# Altium schematic sheet DC_DC_CONVERTER.SchDoc
size A4; SheetNumber: 17; SheetTotal: 20
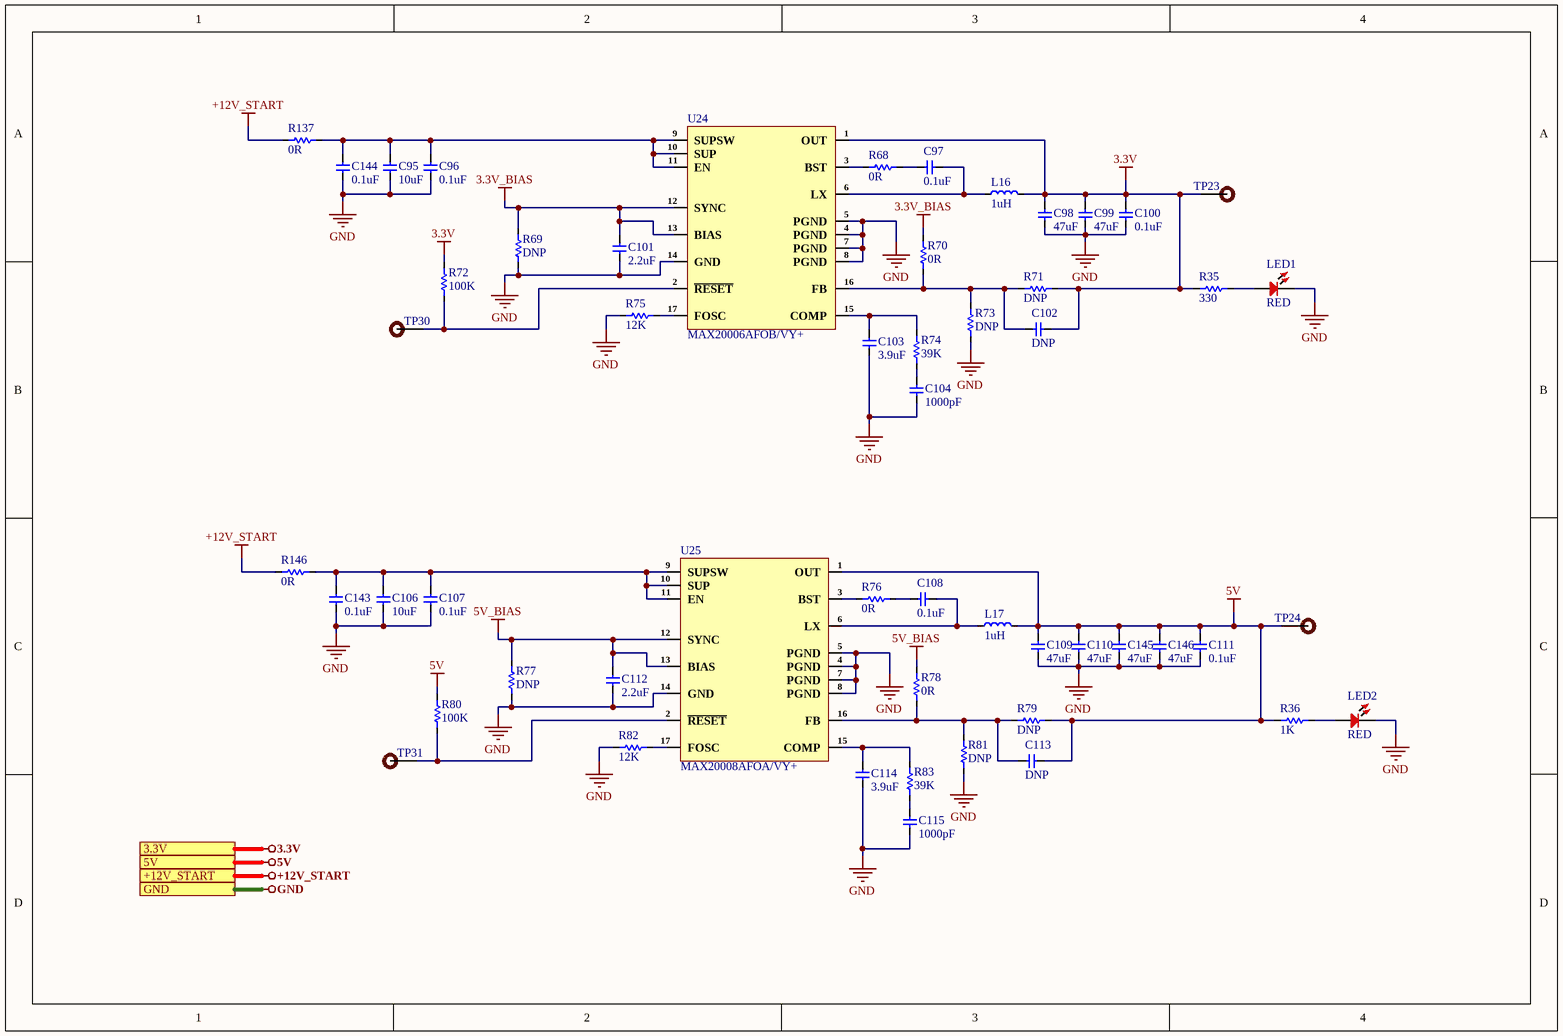
[diagram p0: DC_DC_CONVERTER.SchDoc]

## Parts
C95  10uF  [Cap-1206]
C96  0.1uF  [Cap-0603]
C97  0.1uF  [Cap-0603]
C98  47uF  [Cap 2220]
C99  47uF  [Cap 2220]
C100  0.1uF  [Cap-0402]
C101  2.2uF  [Cap-0603]
C102  DNP  [Cap-0402]
C103  3.9uF  [Cap-1206]
C104  1000pF  [Cap-0603]
C106  10uF  [Cap-1206]
C107  0.1uF  [Cap-0603]
C108  0.1uF  [Cap-0603]
C109  47uF  [Cap 2220]
C110  47uF  [Cap 2220]
C111  0.1uF  [Cap-0402]
C112  2.2uF  [Cap-0603]
C113  DNP  [Cap-0402]
C114  3.9uF  [Cap-1206]
C115  1000pF  [Cap-0603]
C143  0.1uF  [Cap-0603]
C144  0.1uF  [Cap-0603]
C145  47uF  [Cap 2220]
C146  47uF  [Cap 2220]
L16  1uH  [XAL6030-102MEC]
L17  1uH  [XAL6030-102MEC]
LED1  RED  [LED-0603]
LED2  RED  [LED-0603]
R35  330  [Res-0201]
R36  1K  [Res-0603]
R68  0R  [Res-0603]
R69  DNP  [Res-0603]
R70  0R  [Res-0603]
R71  DNP  [Res-0603]
R72  100K  [Res-0603]
R73  DNP  [Res-0603]
R74  39K  [Res-0603]
R75  12K  [Res-0603]
R76  0R  [Res-0603]
R77  DNP  [Res-0603]
R78  0R  [Res-0603]
R79  DNP  [Res-0603]
R80  100K  [Res-0603]
R81  DNP  [Res-0603]
R82  12K  [Res-0603]
R83  39K  [Res-0603]
R137  0R  [Res-1206]
R146  0R  [Res-1206]
TP23  DNP  [Test-point]  (value not drawn)
TP24  DNP  [Test-point]  (value not drawn)
TP30  DNP  [Test-point]  (value not drawn)
TP31  DNP  [Test-point]  (value not drawn)
U24  MAX20006AFOB/VY+  [17-FC2QFN (3.5x3.75)]
U25  MAX20008AFOA/VY+  [17-FC2QFN (3.5x3.75)]

## Ports
3.3V (see Top_Sheet[3D], 03-CAN2_SPI_CAN_CONTROLLER[1D], APALIS_POWER_SUPPLY[1D], CAN2_SPI_CAN_CONTROLLER[1D], GPIO_NC_INTERFACE[4B], I2C_INTERFACE[1B], LTE_MODULE[1D], Reset_and_SDIO[1D]), 5V (see Top_Sheet[4D], 03-CAN2_SPI_CAN_CONTROLLER[1D], CAN2_SPI_CAN_CONTROLLER[1D]), +12V_START (see Top_Sheet[4D], CONNECTORS[1D], DIGITAL_I-O_O-P[1D], INPUT_SUPPLY_PROTECTION[1C]), GND (see Top_Sheet[3D], 03-CAN2_SPI_CAN_CONTROLLER[1D], APALIS_POWER_SUPPLY[1D], CAN2_SPI_CAN_CONTROLLER[1D], CODEC_INTERFACE[1D], CONNECTORS[1D], DIGITAL_I-O_O-P[1D], ETHERNET_INTERFACE[1D], FUTURE_USE_CONNECTOR[1D], GPIO_NC_INTERFACE[4B], HDMI_INTERFACE[1D], I2C_INTERFACE[1B], INPUT_SUPPLY_PROTECTION[1D], LTE_MODULE[1D], MECHANICAL_FOR_PCB[1D], MICRO_SD_CARD_INTERFACE[1D], Reset_and_SDIO[1D], UART_INTERFACE[1D], USB3.0_INTERFACE[1D])

## Nets
3.3V: C98.2 C99.2 C100.2 C102.1 L16.2 R35.1 R71.2 R72.2 TP23.1 U24.1(OUT) ; port 3.3V
3.3V_BIAS: C101.2 R69.2 R70.2 U24.12(SYNC) U24.13(BIAS)
5V: C109.2 C110.2 C111.2 C113.1 C145.2 C146.2 L17.2 R36.1 R79.2 R80.2 TP24.1 U25.1(OUT) ; port 5V
5V_BIAS: C112.2 R77.2 R78.2 U25.12(SYNC) U25.13(BIAS)
+12V_START: R137.1 R146.1 ; port +12V_START
GND: C95.1 C96.1 C98.1 C99.1 C100.1 C101.1 C103.1 C104.1 C106.1 C107.1 C109.1 C110.1 C111.1 C112.1 C114.1 C115.1 C143.1 C144.1 C145.1 C146.1 LED1.2 LED2.2 R69.1 R73.1 R75.1 R77.1 R81.1 R82.1 U24.4(PGND) U24.5(PGND) U24.7(PGND) U24.8(PGND) U24.14(GND) U25.4(PGND) U25.5(PGND) U25.7(PGND) U25.8(PGND) U25.14(GND) ; port GND
NetC95_2: C95.2 C96.2 C144.2 R137.2 U24.9(SUPSW) U24.10(SUP) U24.11(EN)
NetC97_1: C97.1 R68.2
NetC97_2: C97.2 L16.1 U24.6(LX)
NetC102_2: C102.2 R70.1 R71.1 R73.2 U24.16(FB)
NetC103_2: C103.2 R74.2 U24.15(COMP)
NetC104_2: C104.2 R74.1
NetC106_2: C106.2 C107.2 C143.2 R146.2 U25.9(SUPSW) U25.10(SUP) U25.11(EN)
NetC108_1: C108.1 R76.2
NetC108_2: C108.2 L17.1 U25.6(LX)
NetC113_2: C113.2 R78.1 R79.1 R81.2 U25.16(FB)
NetC114_2: C114.2 R83.2 U25.15(COMP)
NetC115_2: C115.2 R83.1
NetLED1_1: LED1.1 R35.2
NetLED2_1: LED2.1 R36.2
NetR68_1: R68.1 U24.3(BST)
NetR72_1: R72.1 TP30.1 U24.2(~{RESET})
NetR75_2: R75.2 U24.17(FOSC)
NetR76_1: R76.1 U25.3(BST)
NetR80_1: R80.1 TP31.1 U25.2(~{RESET})
NetR82_2: R82.2 U25.17(FOSC)

## Library data of the parts
C95 C106 = C3216X7R1V106K160AC: CAP CER 10UF 35V X7R 1206; Manufacturer: TDK; Item Type: Capacitor; Supplier: Rs; Supplier Part Number: 9162964; Manufacturer Part Number: C3216X7R1V106K160AC; RoHS: Yes; Category: Ceramic Capacitors; Stock: 40; Pricing: 10=0.37, 100=0.324, 250=0.278, 500=0.231, 1000=0.185 (GBP); ComponentLink1URL: https://datasheet.ciiva.com/14905/tdkmlcccaprange-14905260.pdf?src-supplier=Digi-Key; ComponentLink1Description: https://datasheet.ciiva.com/14905/tdkmlcccaprange-14905260.pdf?src-supplier=Digi-Key; ComponentLink2URL: https://datasheet.ciiva.com/14905/tdkmlcccaprange-14905261.pdf?src-supplier=Digi-Key; ComponentLink2Description: https://datasheet.ciiva.com/14905/tdkmlcccaprange-14905261.pdf?src-supplier=Digi-Key; ComponentLink3URL: https://datasheet.ciiva.com/14905/tdkmlcccaprange-14905263.pdf?src-supplier=Digi-Key; ComponentLink3Description: https://datasheet.ciiva.com/14905/tdkmlcccaprange-14905263.pdf?src-supplier=Digi-Key
C96 C97 C107 C108 C143 C144 = CGA3E2X7R1H104K080AA: CAP CER 0.1UF 50V X7R 0603; Manufacturer: TDK; Material: 4241ConductorMaterial; Value: 100nF; Tolerance: 10%; Supplier: Rs; Supplier Part Number: 7882985P; Manufacturer Part Number: CGA3E2X7R1H104K080AA; RoHS: Yes; Category: Ceramic Capacitors; Stock: 235650; Pricing: 250=0.037, 500=0.034, 1000=0.033, 2500=0.029 (GBP); Mounting Technology: Surface Mount; Case/Package: 0603; Case Code (Imperial): 0603; Case Code (Metric): 1608; Weight: 7.1E-05oz; Min Operating Temperature: -55°C; Max Operating Temperature: 125°C; Packaging: Tape and Reel; Dielectric: X7R; Voltage Rating (DC): 50V; Package Quantity: 1; Voltage Rating: 50V; Termination: SMD/SMT; Voltage: 50V; Series: CGA; Length: 1.6mm; Width: 0.031inch; Height: 0.8mm; Depth: 0.8mm; Thickness: 0.035inch; Ratings: AEC-Q200; Radiation Hardening: No; Lead Free: Lead Free; RoHS Compliant: Yes; Reach SVHC Compliant: No; ComponentLink1URL: https://datasheet.ciiva.com/24216/cga3e2x7r1h104k080aa-266291-24216208.pdf?src-supplier=Mouser; ComponentLink1Description: https://datasheet.ciiva.com/24216/cga3e2x7r1h104k080aa-266291-24216208.pdf?src-supplier=Mouser; ComponentLink2URL: https://datasheet.ciiva.com/15192/getdatasheetpartid-715867-15192412.pdf?src-supplier=Verical; ComponentLink2Description: https://datasheet.ciiva.com/15192/getdatasheetpartid-715867-15192412.pdf?src-supplier=Verical; ComponentLink3URL: https://datasheet.ciiva.com/22725/1735392-22725642.pdf?src-supplier=Element14; ComponentLink3Description: https://datasheet.ciiva.com/22725/1735392-22725642.pdf?src-supplier=Element14; ComponentLink4URL: https://datasheet.ciiva.com/46385/1735392-46385708.pdf?src-supplier=Element14; ComponentLink4Description: https://datasheet.ciiva.com/46385/1735392-46385708.pdf?src-supplier=Element14; ComponentLink5URL: https://datasheet.ciiva.com/23803/1936565-23803084.pdf?src-supplier=Newark; ComponentLink5Description: https://datasheet.ciiva.com/23803/1936565-23803084.pdf?src-supplier=Newark; ComponentLink6URL: https://datasheet.ciiva.com/16500/mlccspec-automotive-general-midvoltage-en-16500693.pdf?src-supplier=Future+Electronics; ComponentLink6Description: https://datasheet.ciiva.com/16500/mlccspec-automotive-general-midvoltage-en-16500693.pdf?src-supplier=Future+Electronics
C98 C99 C109 C110 C145 C146 = CGA9N3X7R1E476M230KB: CAP CER 47UF 25V X7R 2220; Manufacturer: TDK; Material: 4241ConductorMaterial; Tolerance: 20%; Supplier: Rs; Supplier Part Number: 2427522; Manufacturer Part Number: CGA9N3X7R1E476M230KB; RoHS: Yes; Category: Ceramic Capacitors; Stock: 467; Pricing: 1=3.07, 5=2.92, 10=2.76, 20=2.46, 100=2 (GBP); Mounting Technology: Surface Mount; Case/Package: 2220; Case Code (Imperial): 2220; Case Code (Metric): 5750; Min Operating Temperature: -55°C; Max Operating Temperature: 125°C; Packaging: Cut Tape; Value: 47uF; Voltage Rating: 25V; Series: CGA; Length: 5.7mm; Width: 5mm; Height: 2.8mm; Ratings: AEC-Q200; RoHS Compliant: Yes; ComponentLink1URL: https://product.tdk.com/info/en/catalog/spec/mlccspec_automotive_general_midvoltage_en.pdf?src-supplier=Digi-Key; ComponentLink1Description: https://product.tdk.com/info/en/catalog/spec/mlccspec_automotive_general_midvoltage_en.pdf?src-supplier=Digi-Key; ComponentLink2URL: https://product.tdk.com/info/en/catalog/datasheets/mlcc_automotive_general_en.pdf?src-supplier=Digi-Key; ComponentLink2Description: https://product.tdk.com/info/en/catalog/datasheets/mlcc_automotive_general_en.pdf?src-supplier=Digi-Key; ComponentLink3URL: https://product.tdk.com/info/en/catalog/datasheets/mlcc_automotive_general_en.pdf?ref_disty=digikey&src-supplier=Digi-Key; ComponentLink3Description: https://product.tdk.com/info/en/catalog/datasheets/mlcc_automotive_general_en.pdf?ref_disty=digikey&src-supplier=Digi-Key; ComponentLink4URL: https://datasheet.octopart.com/CGA9N3X7R1E476M230KB-TDK-datasheet-43366117.pdf?src-supplier=Future+Electronics; ComponentLink4Description: https://datasheet.octopart.com/CGA9N3X7R1E476M230KB-TDK-datasheet-43366117.pdf?src-supplier=Future+Electronics
C100 C102 C111 C113 = C0402C104K4REC7867: Cap Cer 0402 0.1UF 16V X7R 10%; Manufacturer: KEMET; Item Type: Capacitor; Supplier: Digi-Key; Supplier Part Number: 399-C0402C104K4REC7867CT-ND; Manufacturer Part Number: C0402C104K4REC7867; RoHS: No; Category: Ceramic Capacitors; Stock: 10918; Pricing: 1=0.1, 10=0.072, 50=0.0408, 100=0.0338, 500=0.02372, 1000=0.01963, 2500=0.01827, 5000=0.01672 (USD)
C101 C112 = C1608X7R1A225K080AC: CAP CER 2.2UF 10V X7R 0603; Manufacturer: TDK; Dielectric Material: Ceramic; Tolerance: 10%; Item type: Capacitor; Supplier: Rs; Supplier Part Number: 9040237; Manufacturer Part Number: C1608X7R1A225K080AC; RoHS: Yes; Category: Ceramic Capacitors; Stock: 4700; Pricing: 50=0.061, 250=0.052, 500=0.043, 1000=0.04, 2000=0.036 (GBP); Mounting Technology: Surface Mount; Case/Package: 0603; Case Code (Metric): 1608; Case Code (Imperial): 0603; Weight: 7.1E-05oz; Min Operating Temperature: -55°C; Max Operating Temperature: 125°C; Packaging: Tape and Reel; Value: 2.2uF; Dielectric: X7R; Construction: Flat; Voltage Rating: 10V; Voltage Rating (DC): 10V; Series: C; Package Quantity: 4000; Termination: SMD/SMT; Length: 1.6mm; Width: 0.8mm; Height: 0.8mm; Depth: 0.8mm; Lead Free: Lead Free; Reach SVHC Compliant: No; RoHS Compliant: Yes; ComponentLink1URL: https://datasheet.ciiva.com/24216/c1608x7r1a225k080ac-264808-24216485.pdf?src-supplier=Mouser; ComponentLink1Description: https://datasheet.ciiva.com/24216/c1608x7r1a225k080ac-264808-24216485.pdf?src-supplier=Mouser; ComponentLink2URL: https://datasheet.ciiva.com/22718/1796654-22718012.pdf?src-supplier=Element14; ComponentLink2Description: https://datasheet.ciiva.com/22718/1796654-22718012.pdf?src-supplier=Element14; ComponentLink3URL: https://datasheet.ciiva.com/6290/tdkmlcccaprange-6290821.pdf?src-supplier=Digi-Key; ComponentLink3Description: https://datasheet.ciiva.com/6290/tdkmlcccaprange-6290821.pdf?src-supplier=Digi-Key; ComponentLink4URL: https://datasheet.ciiva.com/6290/tdkmlcccaprange-6290824.pdf?src-supplier=Digi-Key; ComponentLink4Description: https://datasheet.ciiva.com/6290/tdkmlcccaprange-6290824.pdf?src-supplier=Digi-Key; ComponentLink5URL: https://datasheet.ciiva.com/23802/1796654-23802775.pdf?src-supplier=Newark; ComponentLink5Description: https://datasheet.ciiva.com/23802/1796654-23802775.pdf?src-supplier=Newark; ComponentLink6URL: https://datasheet.ciiva.com/28451/1796654-28451240.pdf?src-supplier=Element14; ComponentLink6Description: https://datasheet.ciiva.com/28451/1796654-28451240.pdf?src-supplier=Element14; ComponentLink7URL: https://datasheet.ciiva.com/22725/1913358-22725529.pdf?src-supplier=Element14; ComponentLink7Description: https://datasheet.ciiva.com/22725/1913358-22725529.pdf?src-supplier=Element14
C103 C114 = C1206C395K3PAC7800: CAP CER 3.9UF 25V X5R 1206; Manufacturer: KEMET; Supplier: Digi-Key; Supplier Part Number: 399-C1206C395K3PAC7800CT-ND; Manufacturer Part Number: C1206C395K3PAC7800; RoHS: Yes; Category: Ceramic Capacitors; Stock: 4449; Pricing: 1=0.72, 10=0.532, 50=0.4252, 100=0.3645, 500=0.28856, 1000=0.243 (USD)
C104 C115 = C1608C0G2A102J080AA: CAP CER 1000PF 100V C0G 0603; Manufacturer: TDK; Item Type: Capacitor; Supplier: Rs; Supplier Part Number: 9040183; Manufacturer Part Number: C1608C0G2A102J080AA; RoHS: Yes; Category: Ceramic Capacitors; Stock: 300; Pricing: 100=0.033, 500=0.031, 1000=0.029, 2500=0.028, 5000=0.025 (GBP); ComponentLink1URL: https://datasheet.ciiva.com/24217/c1608c0g2a102j080aa-264625-24217039.pdf?src-supplier=Mouser; ComponentLink1Description: https://datasheet.ciiva.com/24217/c1608c0g2a102j080aa-264625-24217039.pdf?src-supplier=Mouser; ComponentLink2URL: https://datasheet.ciiva.com/16498/mid-volt-b11-16498805.pdf?src-supplier=Future+Electronics; ComponentLink2Description: https://datasheet.ciiva.com/16498/mid-volt-b11-16498805.pdf?src-supplier=Future+Electronics
L16 L17 = XAL6030-102MEC: Power Inductors - SMD 1uH Shld 20% 18A 6.18mOhms AECQ2; Manufacturer: Coilcraft; Core Material: Composite; Shielding: Shielded; Self Resonant Frequency: 50MHz; Test Frequency: 100kHz; Saturation Current: 23A; Supplier: Mouser; Supplier Part Number: 994-XAL6030-102MEC; Manufacturer Part Number: XAL6030-102MEC; RoHS: Yes; Category: Fixed Inductors; Stock: 25410; Pricing: 1=3.1, 10=3.1, 50=3.1, 100=3.1, 1000=1.82, 10000=1.66 (USD); Mounting Technology: Surface Mount; Case/Package: SMD/SMT; Min Operating Temperature: -40°C; Max Operating Temperature: 125°C; Packaging: Tape and Reel; Package Quantity: 400; Tolerance: 20%; Value: 1uH; Max DC Current: 18A; Termination: SMD/SMT; Series: XAL6030; Inductance Tolerance: 20%; RMS Current (Irms): 18A; Length: 6.76mm; Width: 6.56mm; Height: 3.1mm; Lead Free: Contains Lead; RoHS Compliant: Yes; Reach SVHC Compliant: No; ComponentLink1URL: https://datasheet.ciiva.com/22680/1681993-22680376.pdf?src-supplier=Element14; ComponentLink1Description: https://datasheet.ciiva.com/22680/1681993-22680376.pdf?src-supplier=Element14; ComponentLink2URL: https://datasheet.ciiva.com/22680/1681993-22680375.pdf?src-supplier=Element14; ComponentLink2Description: https://datasheet.ciiva.com/22680/1681993-22680375.pdf?src-supplier=Element14; ComponentLink3URL: https://datasheet.ciiva.com/13277/xal60xx-270658-13277255.pdf?src-supplier=Mouser; ComponentLink3Description: https://datasheet.ciiva.com/13277/xal60xx-270658-13277255.pdf?src-supplier=Mouser
LED1 LED2 = NCD0603R3: RED LED 0603 Light Emitting Diodes; Manufacturer: Foshan NationStar Optoelectronics; Manufacturer Part Number: NCD0603R3; Package: 0603; Item Type: LED; LCSC Part Number: C3151730; ComponentLink1Description: LCSC; ComponentLink1URL: https://www.lcsc.com/product-detail/Light-Emitting-Diodes-LED_Foshan-NationStar-Optoelectronics-NCD0603R3_C3151730.html
R35 = RC0201DR-07330RL: RES 330 OHM 0.5% 1/20W 0201; Manufacturer: Yageo; Value: 330R; Max Power Dissipation: 50mW; Temperature Coefficient: 200ppm/°C; Item Type: Resistor; Supplier 1: Digi-Key; Manufacturer Part Number: RC0201DR-07330RL; RoHS: Yes; Category: Chip SMD Resistors; Pricing 1: 10000=0.02267 (USD); Case/Package: 0201; Min Operating Temperature: -55°C; Max Operating Temperature: 125°C; Packaging: Tape and Reel; Number of Terminations: 2; Tolerance: 0.5%; Features: Moisture Resistant; Series: RC; Length: 0.024inch; Width: 0.012inch; Height: 0.01inch; RoHS Compliant: Yes; ComponentLink1URL: http://www.yageo.com.tw/exep/pages/download/literatures/PYu-R_INT-thick_7.pdf?src-supplier=Digi-Key; ComponentLink1Description: http://www.yageo.com.tw/exep/pages/download/literatures/PYu-R_INT-thick_7.pdf?src-supplier=Digi-Key; Supplier Part Number 1: RC0201DR-07330RL-ND; LCSC Part Number: C851717
R36 = RT0603BRD071KL: RES SMD 1K OHM 0.1% 1/10W 0603; Manufacturer: Yageo; Resistance: 1kR; Power Rating: 100mW; Voltage Rating: 75V; Temperature Coefficient: 25ppm/°C; Voltage Rating (DC): 50V; Item Type: Resistor; Supplier 1: Arrow Electronics; Manufacturer Part Number: RT0603BRD071KL; RoHS: Yes; Category: Chip SMD Resistors; Stock 1: 130000; Pricing 1: 5000=0.03900, 10000=0.03450, 25000=0.03070, 50000=0.02040 (USD); Mount: Surface Mount; Case/Package: 0603; Case Code (Metric): 1608; Case Code (Imperial): 0603; Contact Plating: Tin,Lead; Size Code: 0603; Min Operating Temperature: -55°C; Max Operating Temperature: 125°C; Package Quantity: 5000; Packaging: Tape and Reel; Resistor Type: Thin Film; Number of Terminations: 2; Termination: SMD/SMT; Max Power Dissipation: 100mW; Features: Moisture Resistant; Series: RT; Technology: THIN FILM; Construction: Rectangular; Length: 1.6mm; Width: 0.031inch; Height: 0.022inch; Depth: 0.8mm; Military Standard: Not; Lead Free: Lead Free; RoHS Compliant: Yes; ComponentLink1URL: https://datasheet.ciiva.com/11819/0900766b8079c86e-11819652.pdf?src-supplier=RSComponents; ComponentLink1Description: https://datasheet.ciiva.com/11819/0900766b8079c86e-11819652.pdf?src-supplier=RSComponents; ComponentLink2URL: https://datasheet.ciiva.com/5624/pyu-rt-1-to-0-05-rohs-l-4-5624759.pdf?src-supplier=Mouser; ComponentLink2Description: https://datasheet.ciiva.com/5624/pyu-rt-1-to-0-05-rohs-l-4-5624759.pdf?src-supplier=Mouser; ComponentLink3URL: https://datasheet.ciiva.com/29718/pyu-rt-1-to-0-05-rohs-l-4-29718010.pdf?src-supplier=Digi-Key; ComponentLink3Description: https://datasheet.ciiva.com/29718/pyu-rt-1-to-0-05-rohs-l-4-29718010.pdf?src-supplier=Digi-Key; ComponentLink4URL: https://datasheet.ciiva.com/29718/pyu-rt-1-to-0-05-rohs-l-4-29718011.pdf?src-supplier=Digi-Key; ComponentLink4Description: https://datasheet.ciiva.com/29718/pyu-rt-1-to-0-05-rohs-l-4-29718011.pdf?src-supplier=Digi-Key; Supplier Part Number 1: RT0603BRD071KL; LCSC Part Number: C110776
R68 R70 R76 R78 = ERJ-3GEY0R00V: RES SMD 0 OHM JUMPER 1/10W 0603; Manufacturer: Panasonic; Power Rating: 100mW; Voltage Rating: 75V; Tolerance: 0%; Temperature Coefficient: 200ppm/°C; Voltage Rating (DC): 50V; Supplier: Mouser; Supplier Part Number: 667-ERJ-3GEY0R00V; Manufacturer Part Number: ERJ-3GEY0R00V; RoHS: Yes; Category: Chip SMD Resistors; Stock: 9094861; Pricing: 1=0.1, 10=0.044, 50=0.044, 100=0.019, 1000=0.008, 5000=0.006, 10000=0.004 (USD); Mounting Technology: Surface Mount; Case/Package: 0603; Contact Plating: Tin; Case Code (Metric): 1608; Case Code (Imperial): 0603; Min Operating Temperature: -55°C; Max Operating Temperature: 155°C; Value: 0R; Resistor Type: Thick Film; Packaging: Tape and Reel; Package Quantity: 5000; Number of Terminations: 2; Termination: SMD/SMT; Max Power Dissipation: 100mW; Features: Automotive AEC-Q200; Series: ERJ; Construction: Rectangular; Technology: THICK FILM; Length: 1.6mm; Width: 0.8mm; Height: 0.45mm; Depth: 0.8mm; Ratings: AEC-Q200; Radiation Hardening: No; Reach SVHC Compliant: No; Military Standard: Not; Lead Free: Lead Free; RoHS Compliant: Yes; ComponentLink1URL: https://datasheet.ciiva.com/27055/1935748-27055113.pdf?src-supplier=Jameco; ComponentLink1Description: https://datasheet.ciiva.com/27055/1935748-27055113.pdf?src-supplier=Jameco; ComponentLink2URL: https://datasheet.ciiva.com/11808/0900766b80f806dd-11808207.pdf?src-supplier=Rs; ComponentLink2Description: https://datasheet.ciiva.com/11808/0900766b80f806dd-11808207.pdf?src-supplier=Rs; ComponentLink3URL: https://datasheet.ciiva.com/46377/1678796-46377868.pdf?src-supplier=Element14; ComponentLink3Description: https://datasheet.ciiva.com/46377/1678796-46377868.pdf?src-supplier=Element14; ComponentLink4URL: https://datasheet.ciiva.com/28695/1678796-28695833.pdf?src-supplier=Element14; ComponentLink4Description: https://datasheet.ciiva.com/28695/1678796-28695833.pdf?src-supplier=Element14; ComponentLink5URL: https://datasheet.ciiva.com/16834/aoa0000ce1-16834828.pdf?src-supplier=Future+Electronics; ComponentLink5Description: https://datasheet.ciiva.com/16834/aoa0000ce1-16834828.pdf?src-supplier=Future+Electronics; ComponentLink6URL: https://datasheet.ciiva.com/48532/aoa0000ce1-48532165.pdf?src-supplier=Avnet; ComponentLink6Description: https://datasheet.ciiva.com/48532/aoa0000ce1-48532165.pdf?src-supplier=Avnet; ComponentLink7URL: https://datasheet.ciiva.com/5959/1678796-5959707.pdf?src-supplier=Farnell; ComponentLink7Description: https://datasheet.ciiva.com/5959/1678796-5959707.pdf?src-supplier=Farnell; ComponentLink8URL: https://datasheet.ciiva.com/16758/70255313-16758527.pdf?src-supplier=Allied+Electronics; ComponentLink8Description: https://datasheet.ciiva.com/16758/70255313-16758527.pdf?src-supplier=Allied+Electronics; ComponentLink9URL: https://datasheet.ciiva.com/9198/aoa0000ce1-9198975.pdf?src-supplier=Avnet; ComponentLink9Description: https://datasheet.ciiva.com/9198/aoa0000ce1-9198975.pdf?src-supplier=Avnet; ComponentLink10URL: https://datasheet.ciiva.com/30199/4aoa0000ce1-30199822.pdf?src-supplier=Onlinecomponents.com; ComponentLink10Description: https://datasheet.ciiva.com/30199/4aoa0000ce1-30199822.pdf?src-supplier=Onlinecomponents.com; ComponentLink11URL: https://datasheet.ciiva.com/43460/1678796-43460647.pdf?src-supplier=Farnell; ComponentLink11Description: https://datasheet.ciiva.com/43460/1678796-43460647.pdf?src-supplier=Farnell
R69 R71 R72 R77 R79 R80 = RC0603FR-07100KL: RES 100K OHM 1% 1/10W 0603; Manufacturer: Yageo; Value: 100kR; Temperature Coefficient: 100ppm/°C; Voltage Rating (DC): 50V; Power Rating: 100mW; Supplier: Future Electronics; Supplier Part Number: 3697448; Manufacturer Part Number: RC0603FR-07100KL; RoHS: Yes; Category: Chip SMD Resistors; Stock: 11175000; Pricing: 5000=0.0013, 50000=0.0012, 75000=0.0014, 200000=0.0011, 250000=0.0014, 625000=0.0011, 750000=0.0013, 2000000=0.001, 2500000=0.0012 (USD); Case/Package: 0603; Pins: 2; Case Code (Imperial): 0603; Case Code (Metric): 1608; Min Operating Temperature: -55°C; Max Operating Temperature: 155°C; Tolerance: 1%; Resistor Type: Thick Film; Packaging: Tape and Reel; Voltage Rating: 50V; Termination: SMD/SMT; Number of Terminations: 2; Features: Moisture Resistant; Series: RC; Max Power Dissipation: 100mW; Resistance Tolerance: 1%; Construction: Rectangular; Technology: THICK FILM; Length: 1.6mm; Width: 0.8mm; Height: 0.45mm; Depth: 0.8mm; Reach SVHC Compliant: No; Lead Free: Lead Free; Military Standard: Not; RoHS Compliant: Yes
R73 R81 = ERJ-3GEY0R00V: RES SMD 0 OHM JUMPER 1/10W 0603; Manufacturer: Panasonic; Value: 0R; Power Rating: 100mW; Voltage Rating: 75V; Tolerance: 0%; Temperature Coefficient: 200ppm/°C; Voltage Rating (DC): 50V; Supplier: Mouser; Supplier Part Number: 667-ERJ-3GEY0R00V; Manufacturer Part Number: ERJ-3GEY0R00V; RoHS: Yes; Category: Chip SMD Resistors; Stock: 9094861; Pricing: 1=0.1, 10=0.044, 50=0.044, 100=0.019, 1000=0.008, 5000=0.006, 10000=0.004 (USD); Mounting Technology: Surface Mount; Case/Package: 0603; Contact Plating: Tin; Case Code (Metric): 1608; Case Code (Imperial): 0603; Min Operating Temperature: -55°C; Max Operating Temperature: 155°C; Resistor Type: Thick Film; Packaging: Tape and Reel; Package Quantity: 5000; Number of Terminations: 2; Termination: SMD/SMT; Max Power Dissipation: 100mW; Features: Automotive AEC-Q200; Series: ERJ; Construction: Rectangular; Technology: THICK FILM; Length: 1.6mm; Width: 0.8mm; Height: 0.45mm; Depth: 0.8mm; Ratings: AEC-Q200; Radiation Hardening: No; Reach SVHC Compliant: No; Military Standard: Not; Lead Free: Lead Free; RoHS Compliant: Yes; ComponentLink1URL: https://datasheet.ciiva.com/27055/1935748-27055113.pdf?src-supplier=Jameco; ComponentLink1Description: https://datasheet.ciiva.com/27055/1935748-27055113.pdf?src-supplier=Jameco; ComponentLink2URL: https://datasheet.ciiva.com/11808/0900766b80f806dd-11808207.pdf?src-supplier=Rs; ComponentLink2Description: https://datasheet.ciiva.com/11808/0900766b80f806dd-11808207.pdf?src-supplier=Rs; ComponentLink3URL: https://datasheet.ciiva.com/46377/1678796-46377868.pdf?src-supplier=Element14; ComponentLink3Description: https://datasheet.ciiva.com/46377/1678796-46377868.pdf?src-supplier=Element14; ComponentLink4URL: https://datasheet.ciiva.com/28695/1678796-28695833.pdf?src-supplier=Element14; ComponentLink4Description: https://datasheet.ciiva.com/28695/1678796-28695833.pdf?src-supplier=Element14; ComponentLink5URL: https://datasheet.ciiva.com/16834/aoa0000ce1-16834828.pdf?src-supplier=Future+Electronics; ComponentLink5Description: https://datasheet.ciiva.com/16834/aoa0000ce1-16834828.pdf?src-supplier=Future+Electronics; ComponentLink6URL: https://datasheet.ciiva.com/48532/aoa0000ce1-48532165.pdf?src-supplier=Avnet; ComponentLink6Description: https://datasheet.ciiva.com/48532/aoa0000ce1-48532165.pdf?src-supplier=Avnet; ComponentLink7URL: https://datasheet.ciiva.com/5959/1678796-5959707.pdf?src-supplier=Farnell; ComponentLink7Description: https://datasheet.ciiva.com/5959/1678796-5959707.pdf?src-supplier=Farnell; ComponentLink8URL: https://datasheet.ciiva.com/16758/70255313-16758527.pdf?src-supplier=Allied+Electronics; ComponentLink8Description: https://datasheet.ciiva.com/16758/70255313-16758527.pdf?src-supplier=Allied+Electronics; ComponentLink9URL: https://datasheet.ciiva.com/9198/aoa0000ce1-9198975.pdf?src-supplier=Avnet; ComponentLink9Description: https://datasheet.ciiva.com/9198/aoa0000ce1-9198975.pdf?src-supplier=Avnet; ComponentLink10URL: https://datasheet.ciiva.com/30199/4aoa0000ce1-30199822.pdf?src-supplier=Onlinecomponents.com; ComponentLink10Description: https://datasheet.ciiva.com/30199/4aoa0000ce1-30199822.pdf?src-supplier=Onlinecomponents.com; ComponentLink11URL: https://datasheet.ciiva.com/43460/1678796-43460647.pdf?src-supplier=Farnell; ComponentLink11Description: https://datasheet.ciiva.com/43460/1678796-43460647.pdf?src-supplier=Farnell
R74 R83 = ERJ-3EKF3902V: RES SMD 39K OHM 1% 1/10W 0603; Manufacturer: Panasonic; Supplier: Mouser; Supplier Part Number: 667-ERJ-3EKF3902V; Manufacturer Part Number: ERJ-3EKF3902V; RoHS: Yes; Category: Chip SMD Resistors; Stock: 186285; Pricing: 1=0.1, 10=0.024, 50=0.024, 100=0.011, 1000=0.008, 10000=0.005 (USD); ComponentLink1URL: https://datasheet.ciiva.com/5860/aoa0000ce2-5860662.pdf?src-supplier=Farnell; ComponentLink1Description: https://datasheet.ciiva.com/5860/aoa0000ce2-5860662.pdf?src-supplier=Farnell; ComponentLink2URL: https://datasheet.ciiva.com/9190/aoa0000ce2-9190015.pdf?src-supplier=Avnet; ComponentLink2Description: https://datasheet.ciiva.com/9190/aoa0000ce2-9190015.pdf?src-supplier=Avnet; ComponentLink3URL: https://datasheet.ciiva.com/24165/aoa0000ce2-24165687.pdf?src-supplier=Mouser; ComponentLink3Description: https://datasheet.ciiva.com/24165/aoa0000ce2-24165687.pdf?src-supplier=Mouser; ComponentLink4URL: https://datasheet.ciiva.com/30120/aoa0000ce2-30120364.pdf?src-supplier=Onlinecomponents.com; ComponentLink4Description: https://datasheet.ciiva.com/30120/aoa0000ce2-30120364.pdf?src-supplier=Onlinecomponents.com; ComponentLink5URL: https://datasheet.ciiva.com/46445/1678782-46445791.pdf?src-supplier=Element14; ComponentLink5Description: https://datasheet.ciiva.com/46445/1678782-46445791.pdf?src-supplier=Element14; ComponentLink6URL: https://datasheet.ciiva.com/7944/aoa0000ce2-7944620.pdf?src-supplier=Element14; ComponentLink6Description: https://datasheet.ciiva.com/7944/aoa0000ce2-7944620.pdf?src-supplier=Element14; ComponentLink7URL: https://datasheet.ciiva.com/22684/1678782-22684789.pdf?src-supplier=Element14; ComponentLink7Description: https://datasheet.ciiva.com/22684/1678782-22684789.pdf?src-supplier=Element14; ComponentLink8URL: https://datasheet.ciiva.com/22687/1678782-22687416.pdf?src-supplier=Element14; ComponentLink8Description: https://datasheet.ciiva.com/22687/1678782-22687416.pdf?src-supplier=Element14
R75 R82 = ERJ3EKF1202V: RES SMD 12K OHM 1% 1/10W 0603; Manufacturer: Panasonic; Value: 12kR; Temperature Coefficient: 100ppm/°C; Power Rating: 100mW; Voltage Rating: 75V; Supplier: Mouser; Supplier Part Number: 667-ERJ-3EKF1202V; Manufacturer Part Number: ERJ3EKF1202V; RoHS: Yes; Category: Chip SMD Resistors; Stock: 240811; Pricing: 1=0.1, 10=0.024, 50=0.024, 100=0.011, 1000=0.008, 10000=0.006 (USD); Mounting Technology: Surface Mount; Case/Package: 0603; Pins: 2; Contact Plating: Tin; Case Code (Metric): 1608; Case Code (Imperial): 0603; Weight: 7.1E-05oz; Min Operating Temperature: -55°C; Max Operating Temperature: 155°C; Tolerance: 1%; Packaging: Tape and Reel; Resistor Type: Thick Film; Number of Terminations: 2; Termination: SMD/SMT; Max Power Dissipation: 100mW; Voltage Rating (DC): 75V; Features: Automotive AEC-Q200; Package Quantity: 5000; Series: ERJ; Resistance Tolerance: 1%; Construction: Rectangular; Length: 1.6mm; Width: 0.8mm; Height: 0.45mm; Depth: 0.8mm; Radiation Hardening: No; Reach SVHC Compliant: No; Military Standard: Not; Lead Free: Lead Free; RoHS Compliant: Yes; ComponentLink1URL: https://datasheet.ciiva.com/6138/aoa0000ce2-6138712.pdf?src-supplier=Farnell; ComponentLink1Description: https://datasheet.ciiva.com/6138/aoa0000ce2-6138712.pdf?src-supplier=Farnell; ComponentLink2URL: https://datasheet.ciiva.com/7944/aoa0000ce2-7944617.pdf?src-supplier=Element14; ComponentLink2Description: https://datasheet.ciiva.com/7944/aoa0000ce2-7944617.pdf?src-supplier=Element14; ComponentLink3URL: https://datasheet.ciiva.com/22673/1678782-22673693.pdf?src-supplier=Element14; ComponentLink3Description: https://datasheet.ciiva.com/22673/1678782-22673693.pdf?src-supplier=Element14; ComponentLink4URL: https://datasheet.ciiva.com/22687/1678782-22687413.pdf?src-supplier=Element14; ComponentLink4Description: https://datasheet.ciiva.com/22687/1678782-22687413.pdf?src-supplier=Element14; ComponentLink5URL: https://datasheet.ciiva.com/46420/1678782-46420333.pdf?src-supplier=Element14; ComponentLink5Description: https://datasheet.ciiva.com/46420/1678782-46420333.pdf?src-supplier=Element14; ComponentLink6URL: https://datasheet.ciiva.com/24165/aoa0000ce2-24165037.pdf?src-supplier=Mouser; ComponentLink6Description: https://datasheet.ciiva.com/24165/aoa0000ce2-24165037.pdf?src-supplier=Mouser; ComponentLink7URL: https://datasheet.ciiva.com/16783/70260748-16783400.pdf?src-supplier=Allied+Electronics; ComponentLink7Description: https://datasheet.ciiva.com/16783/70260748-16783400.pdf?src-supplier=Allied+Electronics; ComponentLink8URL: https://datasheet.ciiva.com/30121/aoa0000ce2-30121109.pdf?src-supplier=Onlinecomponents.com; ComponentLink8Description: https://datasheet.ciiva.com/30121/aoa0000ce2-30121109.pdf?src-supplier=Onlinecomponents.com
R137 R146 = RC1206JR-070RL: RES 0 OHM JUMPER 1/4W 1206; Manufacturer: Yageo; Value: 0mR; Tolerance: 5%; Power Rating: 250mW; Voltage Rating: 200V; Temperature Coefficient: 200ppm/°C; Supplier: Future Electronics; Supplier Part Number: 1070203; Manufacturer Part Number: RC1206JR-070RL; RoHS: Yes; Category: Chip SMD Resistors; Stock: 615000; Pricing: 5000=0.0047, 25000=0.0045, 100000=0.0042, 250000=0.0041, 625000=0.0038 (USD); Case/Package: 1206; Contact Plating: Tin,Matte; Case Code (Metric): 3216; Case Code (Imperial): 1206; Min Operating Temperature: -55°C; Max Operating Temperature: 155°C; Resistor Type: Thick Film,Carbon Film; Packaging: Tape and Reel; Package Quantity: 1; Number of Terminations: 2; Termination: SMD/SMT; Max Power Dissipation: 250mW; Series: RC; Resistance Tolerance: 5%; Technology: THICK FILM; Features: Moisture Resistant; Voltage Rating (AC): 200V; Length: 0.122inch; Width: 0.063inch; Height: 0.026inch; Depth: 1.6mm; Lead Free: Lead Free; RoHS Compliant: Yes; Reach SVHC Compliant: Unknown; ComponentLink1URL: https://datasheet.ciiva.com/11808/0900766b80c6630a-11808156.pdf?src-supplier=Rs; ComponentLink1Description: https://datasheet.ciiva.com/11808/0900766b80c6630a-11808156.pdf?src-supplier=Rs; ComponentLink2URL: https://datasheet.ciiva.com/29181/402222-da-01-en-smd-widerstand-0-ohm-1206-29181568.pdf?src-supplier=Conrad; ComponentLink2Description: https://datasheet.ciiva.com/29181/402222-da-01-en-smd-widerstand-0-ohm-1206-29181568.pdf?src-supplier=Conrad; ComponentLink3URL: https://datasheet.ciiva.com/7983/444357-7983807.pdf?src-supplier=Element14; ComponentLink3Description: https://datasheet.ciiva.com/7983/444357-7983807.pdf?src-supplier=Element14; ComponentLink4URL: https://datasheet.ciiva.com/22747/1692832-22747541.pdf?src-supplier=Element14; ComponentLink4Description: https://datasheet.ciiva.com/22747/1692832-22747541.pdf?src-supplier=Element14; ComponentLink5URL: https://datasheet.ciiva.com/46445/444357-46445719.pdf?src-supplier=Element14; ComponentLink5Description: https://datasheet.ciiva.com/46445/444357-46445719.pdf?src-supplier=Element14; ComponentLink6URL: https://datasheet.ciiva.com/2458/pyu-rc1206-51-rohs-l-4-2458669.pdf?src-supplier=Digi-Key; ComponentLink6Description: https://datasheet.ciiva.com/2458/pyu-rc1206-51-rohs-l-4-2458669.pdf?src-supplier=Digi-Key; ComponentLink7URL: https://datasheet.ciiva.com/2458/pyu-rc1206-51-rohs-l-4-2458670.pdf?src-supplier=Digi-Key; ComponentLink7Description: https://datasheet.ciiva.com/2458/pyu-rc1206-51-rohs-l-4-2458670.pdf?src-supplier=Digi-Key; ComponentLink8URL: https://datasheet.ciiva.com/2458/pyu-rc1206-51-rohs-l-4-2458668.pdf?src-supplier=Digi-Key; ComponentLink8Description: https://datasheet.ciiva.com/2458/pyu-rc1206-51-rohs-l-4-2458668.pdf?src-supplier=Digi-Key; ComponentLink9URL: https://datasheet.ciiva.com/7857/1692832-7857422.pdf?src-supplier=Element14; ComponentLink9Description: https://datasheet.ciiva.com/7857/1692832-7857422.pdf?src-supplier=Element14; ComponentLink10URL: https://datasheet.ciiva.com/7857/1692832-7857421.pdf?src-supplier=Element14; ComponentLink10Description: https://datasheet.ciiva.com/7857/1692832-7857421.pdf?src-supplier=Element14; ComponentLink11URL: https://datasheet.ciiva.com/17035/pyu-rc1206-51-rohs-l-4-17035512.pdf?src-supplier=Future+Electronics; ComponentLink11Description: https://datasheet.ciiva.com/17035/pyu-rc1206-51-rohs-l-4-17035512.pdf?src-supplier=Future+Electronics
TP23 TP24 TP30 TP31 = TEST POINT: Test Point ON; Item Type: TEST POINT
U24 = MAX20006AFOB/VY+: 36V, 220KHZ TO 2.2MHZ, 4A/6A/8A; Manufacturer: Maxim; Supplier: Mouser; Supplier Part Number: 700-MAX20006AFOB/VY+; Manufacturer Part Number: MAX20006AFOB/VY+; RoHS: Yes; Category: Voltage Regulators - Switching; Stock: 619; Pricing: 1=5.03, 10=4.28, 50=4.28, 100=3.71, 1000=2.73, 10000=2.6 (USD)
U25 = MAX20008AFOA/VY+: 36V, 220KHZ TO 2.2MHZ, 4A/6A/8A; Manufacturer: Analog Devices; Supplier: Mouser; Supplier Part Number: 700-MAX20008AFOA/VY+; Manufacturer Part Number: MAX20008AFOA/VY+; RoHS: No; Stock: 429; Pricing: 1=5.55, 10=4.86, 50=4.86, 100=4.08, 1000=3.46, 10000=3.46 (USD)